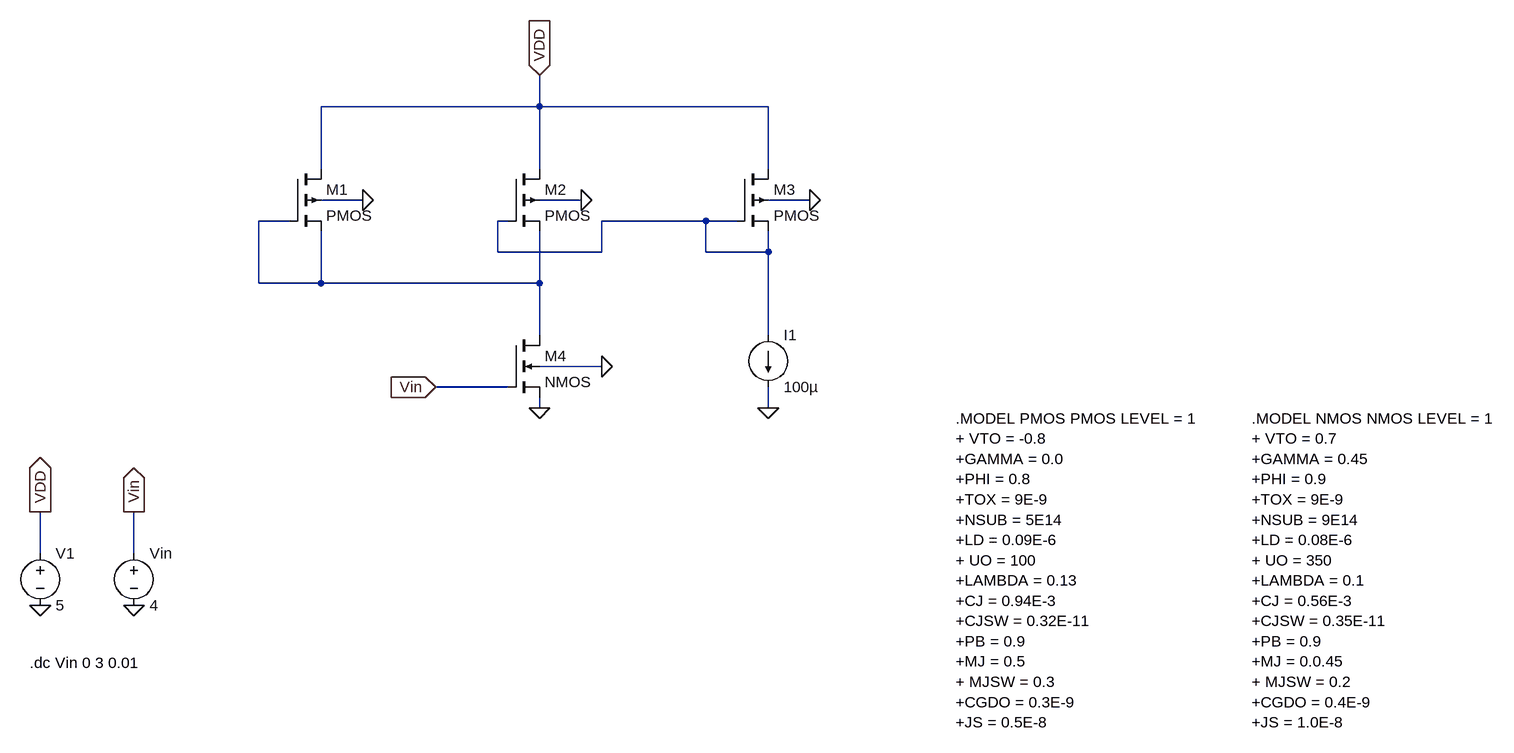
[diagram p0: schematic Simulering.asc]
Simulering.asc, the LTspice schematic file:
Version 4
SHEET 1 672 376
WIRE -768 -496 -768 -544
WIRE -768 -496 -1104 -496
WIRE -416 -496 -768 -496
WIRE -1104 -400 -1104 -496
WIRE -768 -400 -768 -496
WIRE -416 -400 -416 -496
WIRE -1040 -352 -1104 -352
WIRE -704 -352 -768 -352
WIRE -352 -352 -416 -352
WIRE -1152 -320 -1200 -320
WIRE -816 -320 -832 -320
WIRE -512 -320 -672 -320
WIRE -464 -320 -512 -320
WIRE -832 -272 -832 -320
WIRE -672 -272 -672 -320
WIRE -672 -272 -832 -272
WIRE -512 -272 -512 -320
WIRE -416 -272 -416 -304
WIRE -416 -272 -512 -272
WIRE -1200 -224 -1200 -320
WIRE -1104 -224 -1104 -304
WIRE -1104 -224 -1200 -224
WIRE -768 -224 -768 -304
WIRE -768 -224 -1104 -224
WIRE -768 -144 -768 -224
WIRE -416 -144 -416 -272
WIRE -672 -96 -768 -96
WIRE -816 -64 -928 -64
WIRE -768 -32 -768 -48
WIRE -416 -32 -416 -64
WIRE -1536 192 -1536 128
WIRE -1392 192 -1392 128
FLAG -1040 -352 0
FLAG -704 -352 0
FLAG -352 -352 0
FLAG -416 -32 0
FLAG -672 -96 0
FLAG -768 -32 0
FLAG -928 -64 Vin
IOPIN -928 -64 In
FLAG -768 -544 VDD
IOPIN -768 -544 In
FLAG -1536 272 0
FLAG -1392 272 0
FLAG -1536 128 VDD
IOPIN -1536 128 Out
FLAG -1392 128 Vin
IOPIN -1392 128 Out
SYMBOL pmos4 -1152 -400 R0
SYMATTR InstName M1
SYMATTR Value2 l=1um w=1um
SYMBOL pmos4 -816 -400 R0
SYMATTR InstName M2
SYMATTR Value2 l=1um w=1um
SYMBOL pmos4 -464 -400 R0
SYMATTR InstName M3
SYMATTR Value2 l=1um w=1um
SYMBOL current -416 -144 R0
SYMATTR InstName I1
SYMATTR Value 100µ
SYMBOL nmos4 -816 -144 R0
SYMATTR InstName M4
SYMBOL Voltage -1536 176 R0
SYMATTR InstName V1
SYMATTR Value 5
SYMBOL Voltage -1392 176 R0
SYMATTR InstName Vin
SYMATTR Value 4
TEXT -128 -16 Left 2 !.MODEL PMOS PMOS LEVEL = 1\n+ VTO = -0.8\n+GAMMA = 0.0\n+PHI = 0.8\n+TOX = 9E-9\n+NSUB = 5E14\n+LD = 0.09E-6\n+ UO = 100\n+LAMBDA = 0.13\n+CJ = 0.94E-3\n+CJSW = 0.32E-11\n+PB = 0.9\n+MJ = 0.5\n+ MJSW = 0.3\n+CGDO = 0.3E-9\n+JS = 0.5E-8
TEXT 328 -16 Left 2 !.MODEL NMOS NMOS LEVEL = 1\n+ VTO = 0.7\n+GAMMA = 0.45\n+PHI = 0.9\n+TOX = 9E-9\n+NSUB = 9E14\n+LD = 0.08E-6\n+ UO = 350\n+LAMBDA = 0.1\n+CJ = 0.56E-3\n+CJSW = 0.35E-11\n+PB = 0.9\n+MJ = 0.0.45\n+ MJSW = 0.2\n+CGDO = 0.4E-9\n+JS = 1.0E-8
TEXT -1552 360 Left 2 !.dc Vin 0 3 0.01

The netlist it stands for:
* Simulering.asc
M1 VDD N001 N001 0 PMOS l=1um w=1um
M2 VDD N002 N001 0 PMOS l=1um w=1um
M3 VDD N002 N002 0 PMOS l=1um w=1um
I1 N002 0 100µ
M4 N001 Vin 0 0 NMOS
V1 VDD 0 5
Vin Vin 0 4
.model NMOS NMOS
.model PMOS PMOS
.lib standard.mos
.MODEL PMOS PMOS LEVEL = 1
+ VTO = -0.8
+GAMMA = 0.0
+PHI = 0.8
+TOX = 9E-9
+NSUB = 5E14
+LD = 0.09E-6
+ UO = 100
+LAMBDA = 0.13
+CJ = 0.94E-3
+CJSW = 0.32E-11
+PB = 0.9
+MJ = 0.5
+ MJSW = 0.3
+CGDO = 0.3E-9
+JS = 0.5E-8
.MODEL NMOS NMOS LEVEL = 1
+ VTO = 0.7
+GAMMA = 0.45
+PHI = 0.9
+TOX = 9E-9
+NSUB = 9E14
+LD = 0.08E-6
+ UO = 350
+LAMBDA = 0.1
+CJ = 0.56E-3
+CJSW = 0.35E-11
+PB = 0.9
+MJ = 0.0.45
+ MJSW = 0.2
+CGDO = 0.4E-9
+JS = 1.0E-8
.dc Vin 0 3 0.01
.backanno
.end